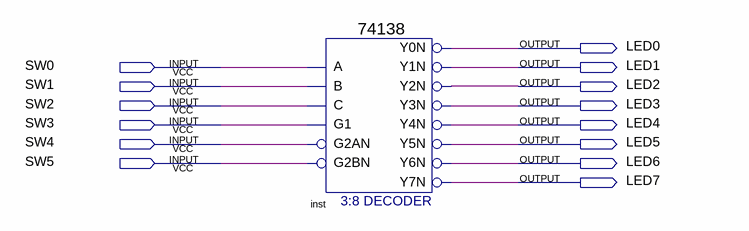
[diagram p0: schematic sheet]
// Quartus schematic CS_74138.bdf as structural Verilog: 1 symbols, 14 pins
module CS_74138 (
  input  SW0,
  input  SW1,
  input  SW2,
  input  SW3,
  input  SW4,
  input  SW5,
  output LED0,
  output LED1,
  output LED2,
  output LED3,
  output LED4,
  output LED5,
  output LED6,
  output LED7
);

  \74138  inst (
    .A(SW0), .B(SW1), .G1(SW3), .C(SW2), .G2AN(SW4), .G2BN(SW5), .Y0N(LED0), .Y1N(LED1), .Y2N(LED2),
    .Y3N(LED3), .Y4N(LED4), .Y5N(LED5), .Y6N(LED6), .Y7N(LED7));
endmodule
